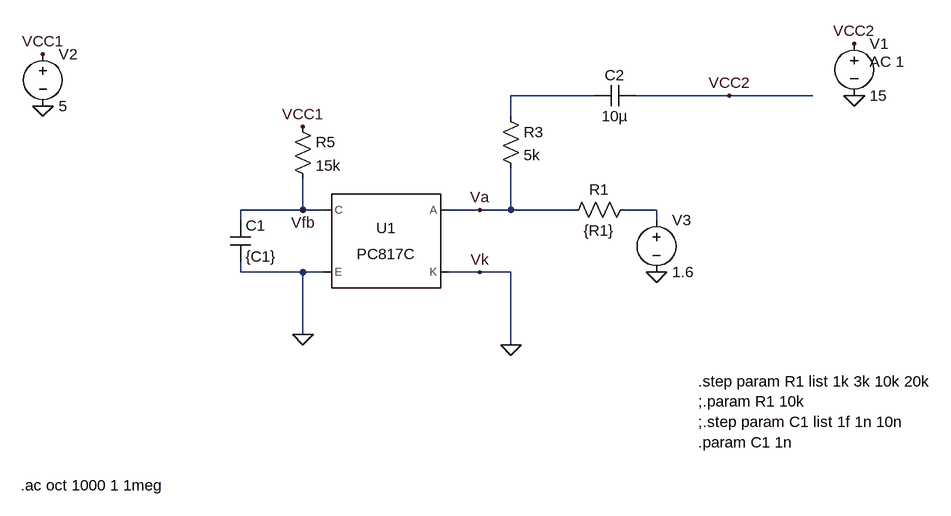
[diagram p0: schematic opto_feedback.asc]
opto_feedback.asc, the LTspice schematic file:
Version 4
SHEET 1 1208 680
WIRE 640 -128 512 -128
WIRE 848 -128 704 -128
WIRE 976 -128 848 -128
WIRE 512 -96 512 -128
WIRE 192 48 192 0
WIRE 192 48 96 48
WIRE 224 48 192 48
WIRE 464 48 416 48
WIRE 512 48 512 -16
WIRE 512 48 464 48
WIRE 608 48 512 48
WIRE 736 48 688 48
WIRE 96 64 96 48
WIRE 736 64 736 48
WIRE 96 144 96 128
WIRE 192 144 96 144
WIRE 224 144 192 144
WIRE 464 144 416 144
WIRE 512 144 464 144
WIRE 192 240 192 144
WIRE 512 256 512 144
FLAG -208 -112 0
FLAG 192 240 0
FLAG 1040 -128 0
FLAG -208 -192 VCC1
FLAG 192 -80 VCC1
FLAG 848 -128 VCC2
FLAG 1040 -208 VCC2
FLAG 192 48 Vfb
FLAG 464 48 Va
FLAG 464 144 Vk
FLAG 512 256 0
FLAG 736 144 0
SYMBOL Optos\\PC817C 320 96 M0
SYMATTR InstName U1
SYMBOL voltage 1040 -224 R0
WINDOW 123 24 44 Left 2
WINDOW 39 0 0 Left 0
SYMATTR InstName V1
SYMATTR Value 15
SYMATTR Value2 AC 1
SYMBOL res 496 -112 R0
SYMATTR InstName R3
SYMATTR Value 5k
SYMBOL res 176 -96 R0
SYMATTR InstName R5
SYMATTR Value 15k
SYMBOL voltage -208 -208 R0
WINDOW 123 0 0 Left 0
WINDOW 39 0 0 Left 0
SYMATTR InstName V2
SYMATTR Value 5
SYMBOL cap 80 64 R0
SYMATTR InstName C1
SYMATTR Value {C1}
SYMBOL res 704 32 R90
WINDOW 0 0 56 VBottom 2
WINDOW 3 32 56 VTop 2
SYMATTR InstName R1
SYMATTR Value {R1}
SYMBOL cap 704 -144 R90
WINDOW 0 0 32 VBottom 2
WINDOW 3 32 32 VTop 2
SYMATTR InstName C2
SYMATTR Value 10µ
SYMBOL voltage 736 48 R0
WINDOW 123 0 0 Left 0
WINDOW 39 0 0 Left 0
SYMATTR InstName V3
SYMATTR Value 1.6
TEXT -242 472 Left 2 !.ac oct 1000 1 1meg
TEXT 800 312 Left 2 !.step param R1 list 1k 3k 10k 20k\n;.param R1 10k\n;.step param C1 list 1f 1n 10n\n.param C1 1n

The netlist it stands for:
* opto_feedback.asc
XU1 Va 0 Vfb 0 PC817 Igain=2.3m  ; PC817C, pins A K C E
V1 VCC2 0 15 AC 1
R3 N001 Va 5k
R5 VCC1 Vfb 15k
V2 VCC1 0 5
C1 Vfb 0 {C1}
R1 N002 Va {R1}
C2 VCC2 N001 10µ
V3 N002 0 1.6
.ac oct 1000 1 1meg
.step param R1 list 1k 3k 10k 20k
;.param R1 10k
;.step param C1 list 1f 1n 10n
.param C1 1n
.lib PC817.sub
.backanno
.end